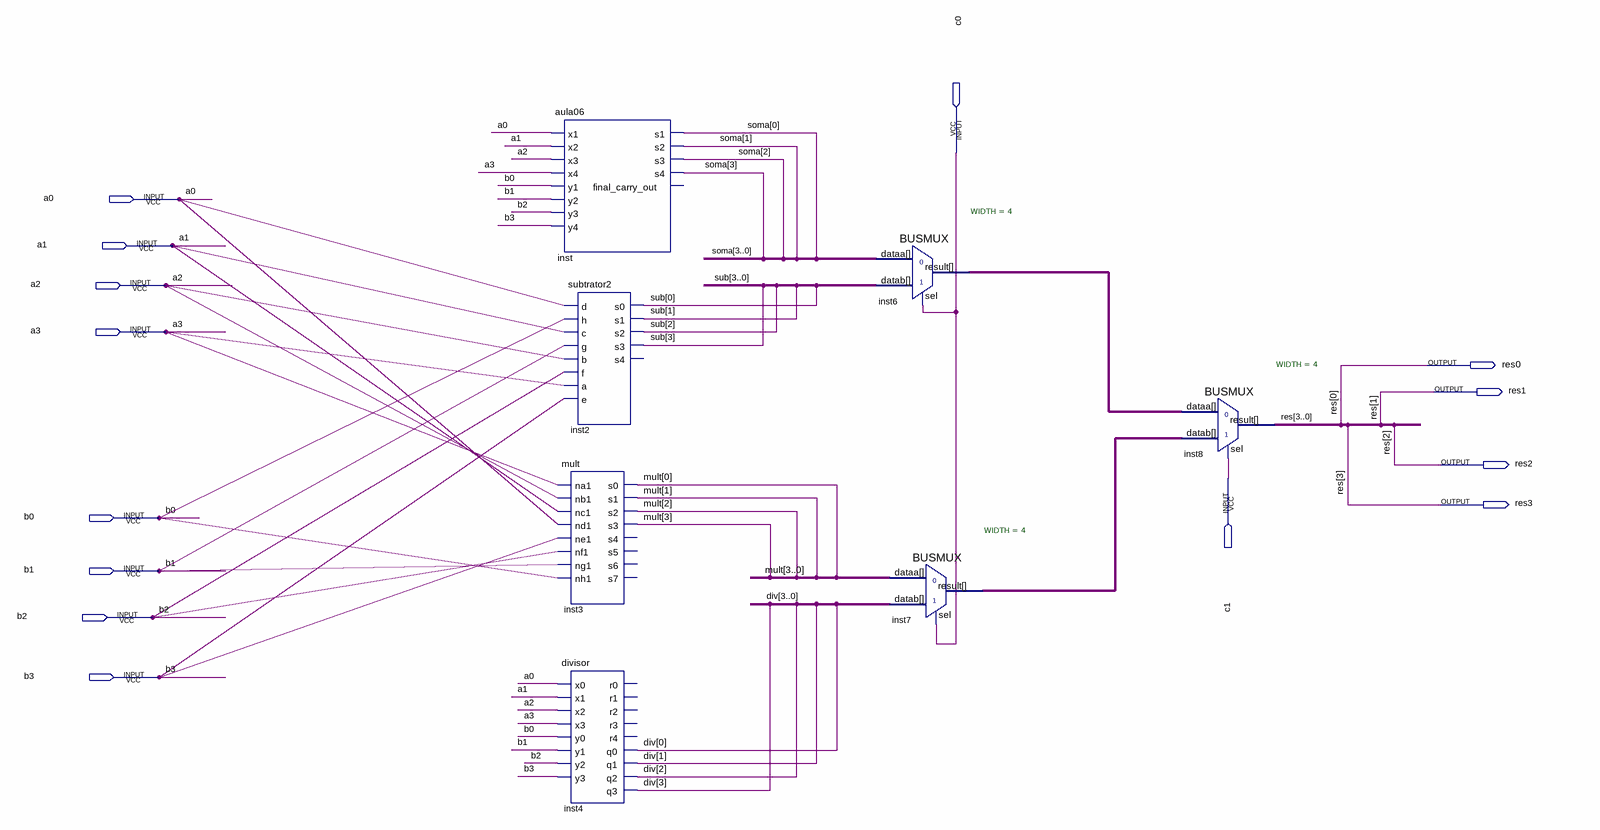
[diagram p0: schematic sheet]
// Quartus schematic ULA.bdf as structural Verilog: 7 symbols, 14 pins
module ULA (
  input  c0,
  input  a0,
  input  a1,
  input  a2,
  input  a3,
  input  c1,
  input  b0,
  input  b1,
  input  b2,
  input  b3,
  output res0,
  output res1,
  output res2,
  output res3
);

  wire [3:0] div, inst6_result, inst7_result, mult, soma, sub;

  aula06 inst (
    .x1(a0), .x2(a1), .x3(a2), .x4(a3), .y1(b0), .y2(b1), .y3(b2), .y4(b3), .s1(soma[0]), .s2(soma[1]),
    .s3(soma[2]), .s4(soma[3]));  // open: final_carry_out
  subtrator2 inst2 (
    .d(a0), .h(b0), .c(a1), .g(b1), .b(a2), .f(b2), .a(a3), .e(b3), .s0(sub[0]), .s1(sub[1]), .s2(sub[2]),
    .s3(sub[3]));  // open: s4
  mult inst3 (
    .na1(a3), .nb1(a2), .nc1(a1), .nd1(a0), .ne1(b3), .nf1(b2), .ng1(b1), .nh1(b0), .s0(mult[0]),
    .s1(mult[1]), .s2(mult[2]), .s3(mult[3]));  // open: s4, s5, s6, s7
  divisor inst4 (
    .x0(a0), .x1(a1), .x2(a2), .x3(a3), .y0(b0), .y1(b1), .y2(b2), .y3(b3), .q0(div[0]), .q1(div[1]),
    .q2(div[2]), .q3(div[3]));  // open: r0, r1, r2, r3, r4
  BUSMUX #(.WIDTH(4)) inst6 (.datab(sub), .sel(c0), .dataa(soma), .result(inst6_result));
  BUSMUX #(.WIDTH(4)) inst7 (.datab(div), .sel(c0), .dataa(mult), .result(inst7_result));
  BUSMUX #(.WIDTH(4)) inst8 (.datab(inst7_result), .sel(c1), .dataa(inst6_result), .result({res3, res2, res1, res0}));
endmodule
